# Altium project Nissan Leaf Waffle.PrjPcb
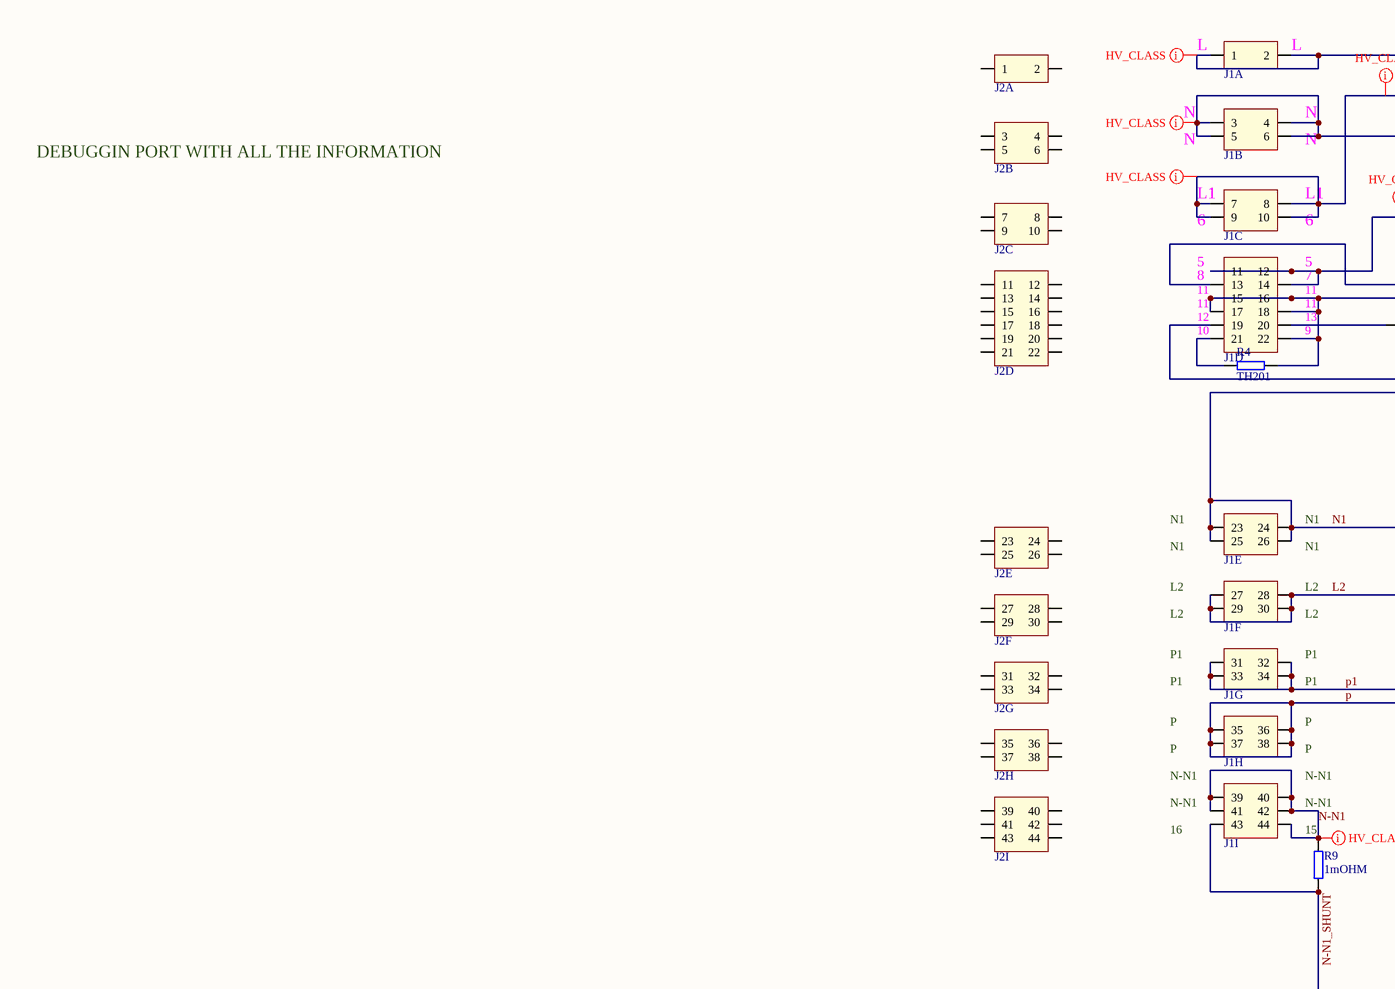
[diagram p0: waffle.SchDoc, left]
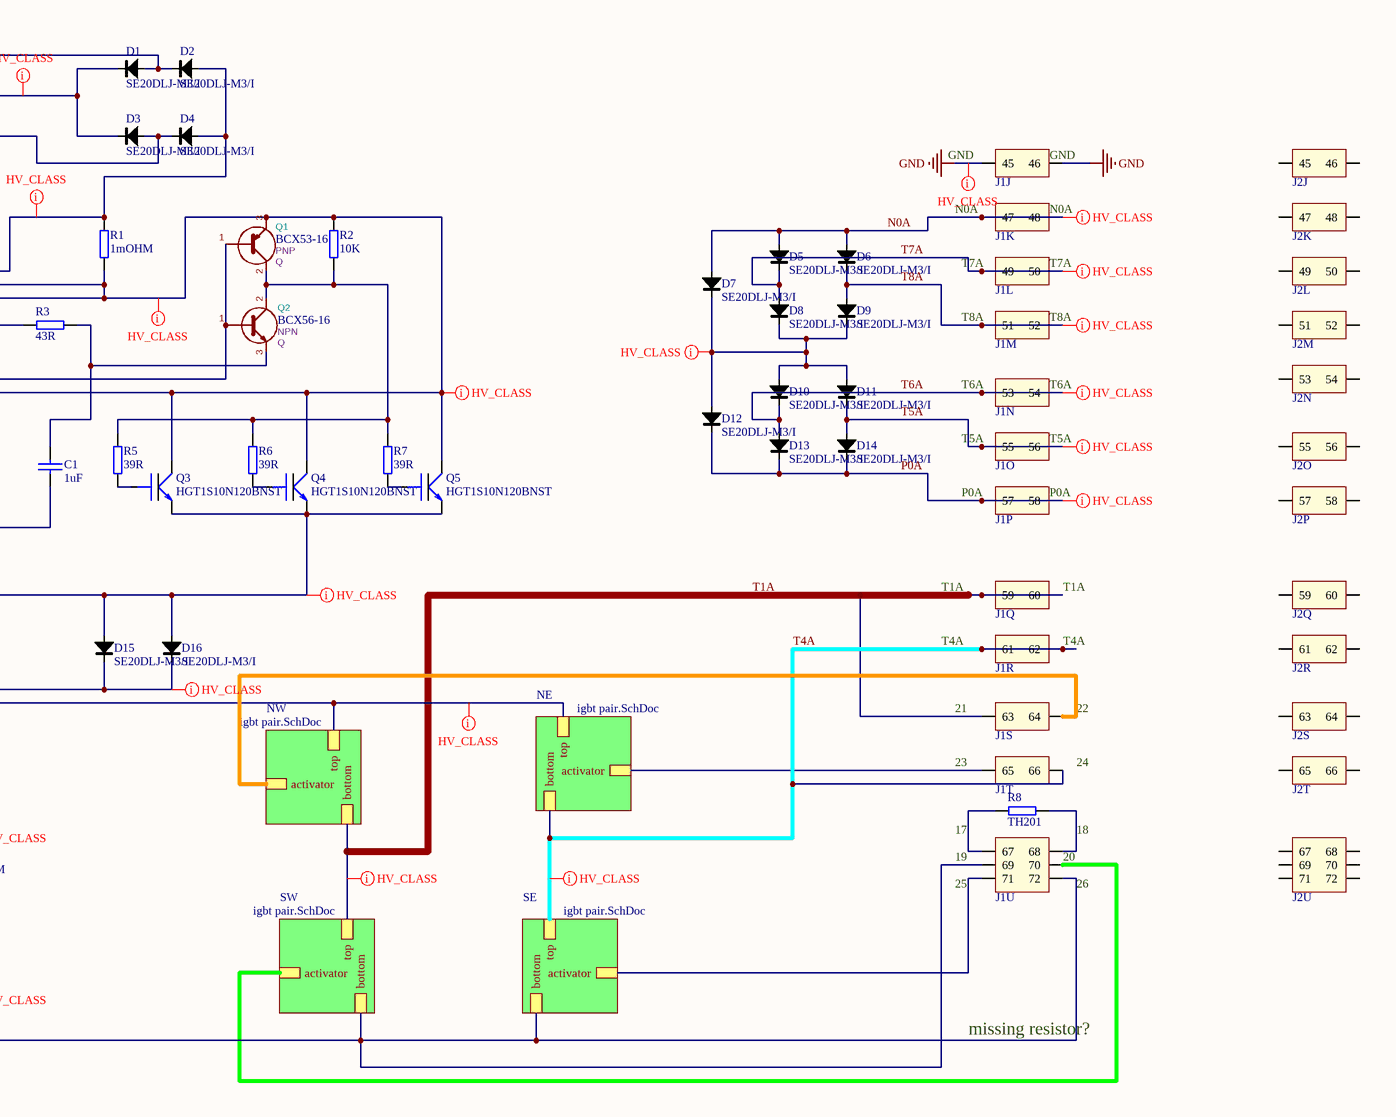
[diagram p1: waffle.SchDoc, right]
2 sheets, 69 parts. Net scope: hierarchical (ports join the sheet entries above them; power ports are global).
Board file: waffle.PcbDoc
Sheets:
  waffle.SchDoc
    NE = igbt pair.SchDoc
    SE = igbt pair.SchDoc
    NW = igbt pair.SchDoc
    SW = igbt pair.SchDoc

## Sheet waffle.SchDoc
size A3; SheetNumber: 1; SheetTotal: 2

### Parts
C1  1uF  [1206]
D1  SE20DLJ-M3/I  [PG-TO252-3 - diode]
D2  SE20DLJ-M3/I  [PG-TO252-3 - diode]
D3  SE20DLJ-M3/I  [PG-TO252-3 - diode]
D4  SE20DLJ-M3/I  [PG-TO252-3 - diode]
D5  SE20DLJ-M3/I  [PG-TO252-3 - diode]
D6  SE20DLJ-M3/I  [PG-TO252-3 - diode]
D7  SE20DLJ-M3/I  [PG-TO252-3 - diode]
D8  SE20DLJ-M3/I  [PG-TO252-3 - diode]
D9  SE20DLJ-M3/I  [PG-TO252-3 - diode]
D10  SE20DLJ-M3/I  [PG-TO252-3 - diode]
D11  SE20DLJ-M3/I  [PG-TO252-3 - diode]
D12  SE20DLJ-M3/I  [PG-TO252-3 - diode]
D13  SE20DLJ-M3/I  [PG-TO252-3 - diode]
D14  SE20DLJ-M3/I  [PG-TO252-3 - diode]
D15  SE20DLJ-M3/I  [PG-TO252-3 - diode]
D16  SE20DLJ-M3/I  [PG-TO252-3 - diode]
J1  connector_waffle  [waffle]  (value not drawn)  (parts A,B,C,D,E,F,G,H,I,J,K,L,M,N,O,P,Q,R,S,T,U of 21)
J2  connector_waffle  [waffle]  (value not drawn)  (parts A,B,C,D,E,F,G,H,I,J,K,L,M,N,O,P,Q,R,S,T,U of 21)
Q1  BCX53-16  value PNP  Reference: Q  [SOT-89]
Q2  BCX56-16  value NPN  Reference: Q  [SOT-89]
Q3  HGT1S10N120BNST  [PG-TO252-3]
Q4  HGT1S10N120BNST  [PG-TO252-3]
Q5  HGT1S10N120BNST  [PG-TO252-3]
R1  1mOHM  [1206]
R2  10K  [1206]
R3  43R  [1206]
R4  value TH201  [1206]  (hidden comment: NB20N50104JBA)
R5  39R  [1206]
R6  39R  [1206]
R7  39R  [1206]
R8  value TH201  [1206]  (hidden comment: NB20N50104JBA)
R9  1mOHM  [1206]

### Sub-sheets
NE = igbt pair.SchDoc: top, bottom, activator
NW = igbt pair.SchDoc: top, bottom, activator
SE = igbt pair.SchDoc: top, bottom, activator
SW = igbt pair.SchDoc: top, bottom, activator

### Nets
GND: J1.45 J1.46
L2: D15.A D16.A J1.27 J1.28 J1.29 J1.30 Q3.2(E) Q4.2(E) Q5.2(E)
N0A: D5.A D6.A D7.A J1.47 J1.48
N1: C1.2 J1.13 J1.15 J1.16 J1.17 J1.18 J1.22 J1.23 J1.24 J1.25 J1.26 Q1.3(E) Q3.3(C) Q4.3(C) Q5.3(C) R1.1 R2.2 R4.2
N-N1: J1.39 J1.40 J1.41 J1.42 J1.44 R9.2
N-N1_SHUNT: J1.43 J1.69 J1.72 R9.1 ; sheet SE/bottom, sheet SW/bottom
p: J1.35 J1.36 J1.37 J1.38 ; sheet NE/top, sheet NW/top
P0A: D12.K D13.K D14.K J1.57 J1.58
p1: D15.K D16.K J1.31 J1.32 J1.33 J1.34
T1A: J1.59 J1.60 J1.63 ; sheet NW/bottom, sheet SW/top
T4A: J1.61 J1.62 J1.66 ; sheet NE/bottom, sheet SE/top
T5A: D11.K D14.A J1.55 J1.56
T6A: D10.K D13.A J1.53 J1.54
T7A: D5.K D8.A J1.49 J1.50
T8A: D6.K D9.A J1.51 J1.52
NetC1_1: C1.1 Q2.3(E) R3.2
NetD1_A: D1.A D2.K J1.1 J1.2
NetD1_K: D1.K D3.K J1.7 J1.8 J1.9 J1.10
NetD2_A: D2.A D4.A J1.11 J1.12 J1.14 R1.2
NetD3_A: D3.A D4.K J1.3 J1.4 J1.5 J1.6
NetD7_K: D7.K D8.K D9.K D10.A D11.A D12.A
NetJ1_19: J1.19 Q1.1(B) Q2.1(B)
NetJ1_20: J1.20 R3.1
NetJ1_21: J1.21 R4.1
NetJ1_64: J1.64 ; sheet NW/activator
NetJ1_65: J1.65 ; sheet NE/activator
NetJ1_67: J1.67 R8.1
NetJ1_68: J1.68 R8.2
NetJ1_70: J1.70 ; sheet SW/activator
NetJ1_71: J1.71 ; sheet SE/activator
NetQ1_2: Q1.2(C) Q2.2(C) R2.1 R5.2 R6.2 R7.2
NetQ3_1: Q3.1(B) R5.1
NetQ4_1: Q4.1(B) R6.1
NetQ5_1: Q5.1(B) R7.1

Not connected (* = marked no-connect by the designer): J2 1 2 3 4 5 6 7 8 9 10 11 12 13 14 15 16 17 18 19 20 21 22 23 24 25 26 27 28 29 30 31 32 33 34 35 36 37 38 39 40 41 42 43 44 45 46 47 48 49 50 51 52 53 54 55 56 57 58 59 60 61 62 63 64 65 66 67 68 69 70 71 72

### Layout directives
net class HV_CLASS: GND, L2, N0A, N1, N-N1, N-N1_SHUNT, NetD1_A, NetD1_K, NetD2_A, NetD3_A, NetD7_K, p, P0A, p1, T1A, T4A, T5A, T6A, T7A, T8A

### Notes on the sheet
- (near J1) L
- (near J1) N
- DEBUGGIN PORT WITH ALL THE INFORMATION
- (near J1) GND
- (near J1) L1
- (near J1) 6
- (near J1) N0A
- (near J1) 5
- (near J1) 8
- (near J1) 11
- (near J1) 12
- (near J1) 7
- (near J1) 13
- (near J1) T7A
- (near J1) T8A
- (near J1) 10
- (near J1) 9
- (near J1) T6A
- (near J1) T5A
- (near J1) N1
- (near J1) P0A
- (near J1) L2
- (near J1) T1A
- (near J1) P1
- (near J1) T4A
- (near J1) P
- (near J1) 21
- (near J1) 22
- (near J1) N-N1
- (near J1) 23
- (near J1) 24
- (near J1) 16
- N-N1
- (near R9) 15
- (near J1) 19
- 17
- (near J1) 20
- 18
- (near J1) 25
- (near J1) 26
- missing resistor?
- Title:
- Project:
- Sheet:
- of
- Engineer:
- Date:
- Revision:

### Library data of the parts
C1 = CAP_1uF: 1206 1UF 50V; Tolerance: 1-5%; Voltage: 50V; Value: 1uF
D1-D4 = 25V60: Diode rectifier 1V/1A/700V; Supplier 1: Digikey; Supplier Part Number 1: 112-VS-E5TX3012S2L-M3CT-ND; Supplier 2: Mouser; Supplier Part Number 2: 78-VS-E5TX3012S2L-M3
D5-D16 = 20L60U: Diode rectifier 1V/1A/700V; Supplier 1: Mouser; Supplier Part Number 1: 78-VS-E5TX3012S2L-M3
Q1 = BCX53-16: BCX53-16   PNP; ki_keywords: NPN Bipolar Transistor; ki_description: Symbol for NPN BJT; Supplier 1: Mouser; Supplier Part Number 1: 726-BCX5316H6327XTSA
Q2 = BCX56-16: BCX56-16 / NPN; ki_keywords: NPN Bipolar Transistor; ki_description: Symbol for NPN BJT; Supplier 1: Mouser; Supplier Part Number 1: 726-BCX5616H6327XTSA
Q3 Q4 = FGB20N60SF: IGBT N type 20A(40) 600V dpakpossible replacement STB27NM60ND / FGB20N60SF / RJP6012; Supplier 1: Rs; Supplier Part Number 1: 8076660P; Supplier 2: Mouser; Supplier Part Number 2: 512-HGT1S10N120BNST
Q5 = FGB20N60SF: HGT1S10N120BNST / IGBT N type 20A(40) 600V dpakpossible replacement STB27NM60ND / FGB20N60SF / RJP6012; Supplier 1: Rs; Supplier Part Number 1: 8076660P; Supplier 2: Mouser; Supplier Part Number 2: 512-HGT1S10N120BNST
R1 R9 = RES_shunt: resistor 1206 1mohm.; Power: 1/2W; Tolerance: 1%; Value: 1mOHM
R2 = RES_10K: resistor 10K 1206; Power: 1/2W; Tolerance: 1%; Value: 10K
R3 = RES_43R: resistor 43R 1206; Power: 1/2W; Tolerance: 1%; Value: 43R
R4 R8 = RES_TH: NB20N50104JBA: resistor NTC 100K; Power: 1/2W; Tolerance: 1%
R5-R7 = RES_39R: resistor 39R 1206; Power: 1/2W; Tolerance: 1%; Value: 39R

## Sheet igbt pair.SchDoc
size A; SheetNumber: 2; SheetTotal: 2
Used 4 times, as channels NE, SE, NW, SW. Parts and nets are listed once, with the designators drawn on the sheet.
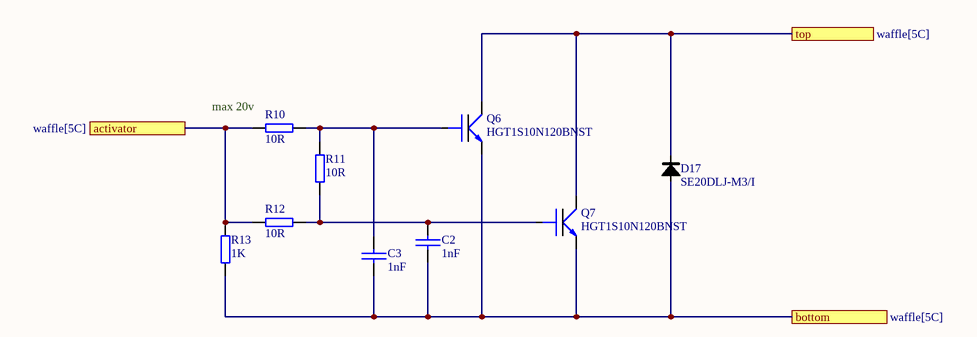
[diagram p2: igbt pair.SchDoc]

### Parts
C2  1nF  [1206]
C3  1nF  [1206]
D17  SE20DLJ-M3/I  [PG-TO252-3 - diode]
Q6  HGT1S10N120BNST  [PG-TO252-3]
Q7  HGT1S10N120BNST  [PG-TO252-3]
R10  10R  [1206]
R11  10R  [1206]
R12  10R  [1206]
R13  1K  [1206]

### Ports
activator (see waffle[5C]), bottom (see waffle[5C]), top (see waffle[5C])

### Nets
activator: R10.1 R12.1 R13.2 ; port activator
bottom: C2.2 C3.2 D17.A Q6.2(E) Q7.2(E) R13.1 ; port bottom
top: D17.K Q6.3(C) Q7.3(C) ; port top
NetC2_1: C2.1 Q7.1(B) R11.1 R12.2
NetC3_1: C3.1 Q6.1(B) R10.2 R11.2

### Channels
NE: designators end in NE; ports activator=NetJ1_65 bottom=T4A top=p
SE: designators end in SE; ports activator=NetJ1_71 bottom=N-N1_SHUNT top=T4A
NW: designators end in NW; ports activator=NetJ1_64 bottom=T1A top=p
SW: designators end in SW; ports activator=NetJ1_70 bottom=N-N1_SHUNT top=T1A

### Notes on the sheet
- (near R10) max 20v

### Library data of the parts
C2 C3 = CAP_1nF: CAPACITOR 1nF 1206; Voltage: 50V; Tolerance: 1-5%; Value: 1nF
D17 = STTH5R06B: Supplier 1: Mouser; Supplier Part Number 1: 78-VS-E5TX3012S2L-M3
Q6 Q7 = FGB20N60SF: as Q3 on sheet waffle; Supplier 1: Rs; Supplier Part Number 1: 8076660P; Supplier 2: Mouser; Supplier Part Number 2: 512-HGT1S10N120BNST
R10-R12 = RES_10R: resistor; Power: 1/2W; Tolerance: 1%; Value: 10R
R13 = RES_1K: resistor 1k 1206; Power: 1/2W; Tolerance: 1%; Value: 1K

## Nets that join several sheets
N-N1_SHUNT: waffle (J1.43 J1.69 J1.72 R9.1), SE (6 pins), SW (6 pins)
NetJ1_64: waffle (J1.64), NW (R10NW.1 R12NW.1 R13NW.2)
NetJ1_65: waffle (J1.65), NE (R10NE.1 R12NE.1 R13NE.2)
NetJ1_70: waffle (J1.70), SW (R10SW.1 R12SW.1 R13SW.2)
NetJ1_71: waffle (J1.71), SE (R10SE.1 R12SE.1 R13SE.2)
p: waffle (J1.35 J1.36 J1.37 J1.38), NE (D17NE.K Q6NE.3 Q7NE.3), NW (D17NW.K Q6NW.3 Q7NW.3)
T1A: waffle (J1.59 J1.60 J1.63), NW (6 pins), SW (D17SW.K Q6SW.3 Q7SW.3)
T4A: waffle (J1.61 J1.62 J1.66), NE (6 pins), SE (D17SE.K Q6SE.3 Q7SE.3)